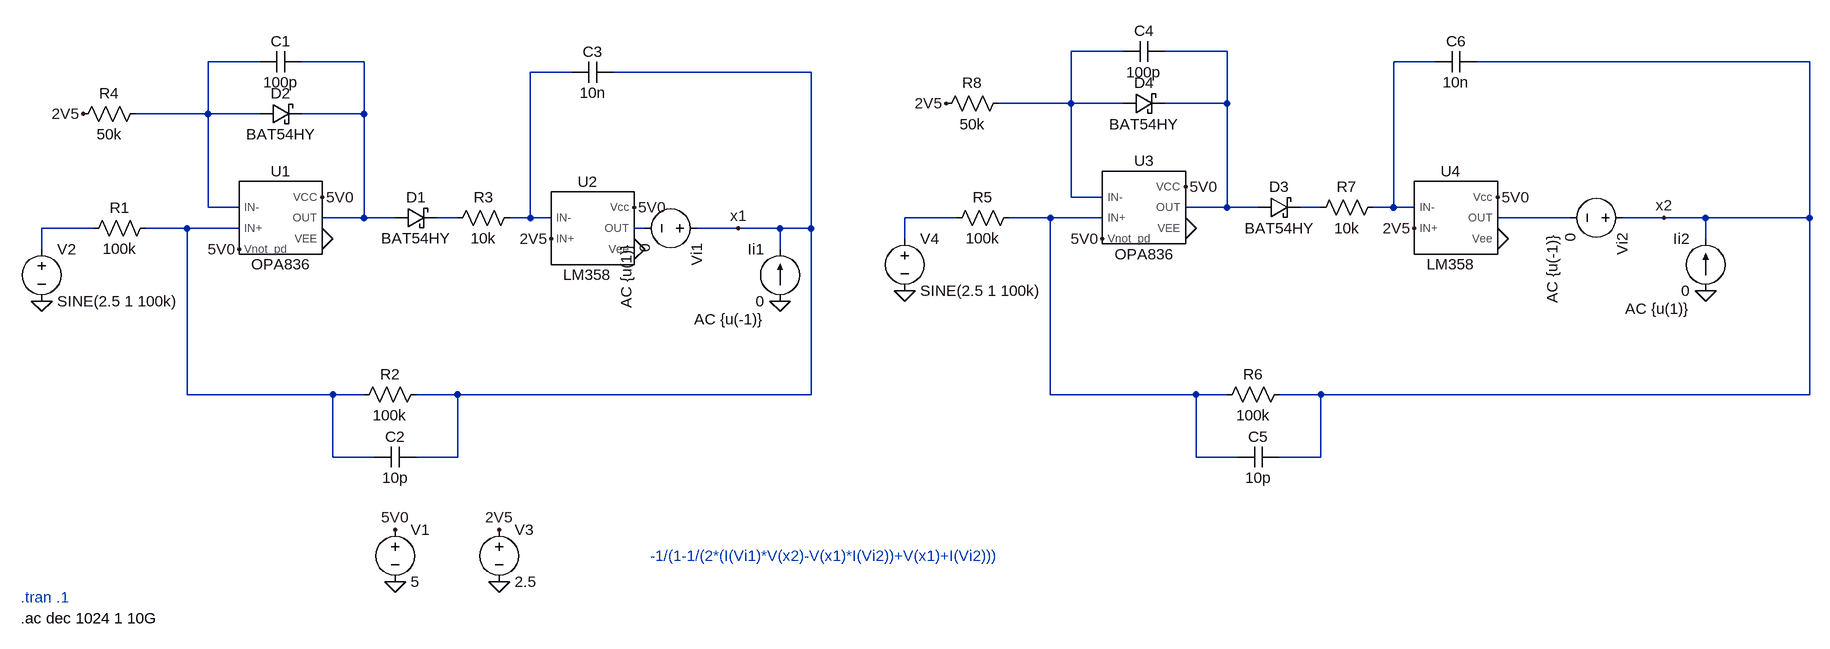
[diagram p0: schematic PeakDetector.asc]
PeakDetector.asc, the LTspice schematic file:
Version 4.1
SHEET 1 2504 1324
WIRE 1440 -96 1360 -96
WIRE 1600 -96 1504 -96
WIRE 112 -80 32 -80
WIRE 272 -80 176 -80
WIRE 1920 -80 1856 -80
WIRE 2496 -80 1984 -80
WIRE 592 -64 528 -64
WIRE 960 -64 656 -64
WIRE 1360 -16 1360 -96
WIRE 1360 -16 1248 -16
WIRE 1440 -16 1360 -16
WIRE 1600 -16 1600 -96
WIRE 1600 -16 1504 -16
WIRE 32 0 32 -80
WIRE 32 0 -80 0
WIRE 112 0 32 0
WIRE 272 0 272 -80
WIRE 272 0 176 0
WIRE 1360 128 1360 -16
WIRE 1408 128 1360 128
WIRE 32 144 32 0
WIRE 80 144 32 144
WIRE 1600 144 1600 -16
WIRE 1600 144 1536 144
WIRE 1648 144 1600 144
WIRE 1744 144 1712 144
WIRE 1856 144 1856 -80
WIRE 1856 144 1824 144
WIRE 1888 144 1856 144
WIRE 272 160 272 0
WIRE 272 160 208 160
WIRE 320 160 272 160
WIRE 416 160 384 160
WIRE 528 160 528 -64
WIRE 528 160 496 160
WIRE 560 160 528 160
WIRE 1184 160 1104 160
WIRE 1328 160 1264 160
WIRE 1408 160 1328 160
WIRE 2128 160 2016 160
WIRE 2272 160 2208 160
WIRE 2336 160 2272 160
WIRE 2496 160 2496 -80
WIRE 2496 160 2336 160
WIRE -144 176 -224 176
WIRE 0 176 -64 176
WIRE 80 176 0 176
WIRE 704 176 688 176
WIRE 848 176 784 176
WIRE 912 176 848 176
WIRE 960 176 960 -64
WIRE 960 176 912 176
WIRE 1104 192 1104 160
WIRE 2336 192 2336 160
WIRE -224 208 -224 176
WIRE 912 208 912 176
WIRE 0 432 0 176
WIRE 224 432 0 432
WIRE 272 432 224 432
WIRE 416 432 352 432
WIRE 960 432 960 176
WIRE 960 432 416 432
WIRE 1328 432 1328 160
WIRE 1552 432 1328 432
WIRE 1600 432 1552 432
WIRE 1744 432 1680 432
WIRE 2496 432 2496 160
WIRE 2496 432 1744 432
WIRE 224 528 224 432
WIRE 288 528 224 528
WIRE 416 528 416 432
WIRE 416 528 352 528
WIRE 1552 528 1552 432
WIRE 1616 528 1552 528
WIRE 1744 528 1744 432
WIRE 1744 528 1680 528
FLAG 320 720 0
FLAG 320 640 5V0
FLAG 208 192 0
FLAG 688 208 0
FLAG 208 128 5V0
FLAG 688 144 5V0
FLAG 80 208 5V0
FLAG -224 288 0
FLAG 480 720 0
FLAG 480 640 2V5
FLAG 560 192 2V5
FLAG -160 0 2V5
FLAG 1536 176 0
FLAG 2016 192 0
FLAG 1536 112 5V0
FLAG 2016 128 5V0
FLAG 1408 192 5V0
FLAG 1104 272 0
FLAG 1888 176 2V5
FLAG 1168 -16 2V5
FLAG 848 176 x1
FLAG 2272 160 x2
FLAG 912 288 0
FLAG 2336 272 0
SYMBOL OPA836 144 160 R0
SYMATTR InstName U1
SYMBOL schottky 320 176 R270
WINDOW 0 32 32 VTop 2
WINDOW 3 0 32 VBottom 2
SYMATTR InstName D1
SYMATTR Value BAT54HY
SYMATTR Description Diode
SYMATTR Type diode
SYMBOL voltage 320 624 R0
WINDOW 123 0 0 Left 0
WINDOW 39 0 0 Left 0
SYMATTR InstName V1
SYMATTR Value 5
SYMBOL res -48 160 R90
WINDOW 0 0 56 VBottom 2
WINDOW 3 32 56 VTop 2
SYMATTR InstName R1
SYMATTR Value 100k
SYMBOL res 368 416 R90
WINDOW 0 0 56 VBottom 2
WINDOW 3 32 56 VTop 2
SYMATTR InstName R2
SYMATTR Value 100k
SYMBOL schottky 112 16 R270
WINDOW 0 32 32 VTop 2
WINDOW 3 0 32 VBottom 2
SYMATTR InstName D2
SYMATTR Value BAT54HY
SYMATTR Description Diode
SYMATTR Type diode
SYMBOL cap 176 -96 R90
WINDOW 0 0 32 VBottom 2
WINDOW 3 32 32 VTop 2
SYMATTR InstName C1
SYMATTR Value 100p
SYMBOL cap 352 512 R90
WINDOW 0 0 32 VBottom 2
WINDOW 3 32 32 VTop 2
SYMATTR InstName C2
SYMATTR Value 10p
SYMBOL res 512 144 R90
WINDOW 0 0 56 VBottom 2
WINDOW 3 32 56 VTop 2
SYMATTR InstName R3
SYMATTR Value 10k
SYMBOL cap 656 -80 R90
WINDOW 0 0 32 VBottom 2
WINDOW 3 32 32 VTop 2
SYMATTR InstName C3
SYMATTR Value 10n
SYMBOL res -64 -16 R90
WINDOW 0 0 56 VBottom 2
WINDOW 3 32 56 VTop 2
SYMATTR InstName R4
SYMATTR Value 50k
SYMBOL voltage -224 192 R0
WINDOW 123 0 0 Left 0
WINDOW 39 0 0 Left 0
SYMATTR InstName V2
SYMATTR Value SINE(2.5 1 100k)
SYMBOL LM358 608 176 R0
SYMATTR InstName U2
SYMBOL voltage 480 624 R0
WINDOW 123 0 0 Left 0
WINDOW 39 0 0 Left 0
SYMATTR InstName V3
SYMATTR Value 2.5
SYMBOL OPA836 1472 144 R0
SYMATTR InstName U3
SYMBOL schottky 1648 160 R270
WINDOW 0 32 32 VTop 2
WINDOW 3 0 32 VBottom 2
SYMATTR InstName D3
SYMATTR Value BAT54HY
SYMATTR Description Diode
SYMATTR Type diode
SYMBOL res 1280 144 R90
WINDOW 0 0 56 VBottom 2
WINDOW 3 32 56 VTop 2
SYMATTR InstName R5
SYMATTR Value 100k
SYMBOL res 1696 416 R90
WINDOW 0 0 56 VBottom 2
WINDOW 3 32 56 VTop 2
SYMATTR InstName R6
SYMATTR Value 100k
SYMBOL schottky 1440 0 R270
WINDOW 0 32 32 VTop 2
WINDOW 3 0 32 VBottom 2
SYMATTR InstName D4
SYMATTR Value BAT54HY
SYMATTR Description Diode
SYMATTR Type diode
SYMBOL cap 1504 -112 R90
WINDOW 0 0 32 VBottom 2
WINDOW 3 32 32 VTop 2
SYMATTR InstName C4
SYMATTR Value 100p
SYMBOL cap 1680 512 R90
WINDOW 0 0 32 VBottom 2
WINDOW 3 32 32 VTop 2
SYMATTR InstName C5
SYMATTR Value 10p
SYMBOL res 1840 128 R90
WINDOW 0 0 56 VBottom 2
WINDOW 3 32 56 VTop 2
SYMATTR InstName R7
SYMATTR Value 10k
SYMBOL cap 1984 -96 R90
WINDOW 0 0 32 VBottom 2
WINDOW 3 32 32 VTop 2
SYMATTR InstName C6
SYMATTR Value 10n
SYMBOL res 1264 -32 R90
WINDOW 0 0 56 VBottom 2
WINDOW 3 32 56 VTop 2
SYMATTR InstName R8
SYMATTR Value 50k
SYMBOL voltage 1104 176 R0
WINDOW 123 0 0 Left 0
WINDOW 39 0 0 Left 0
SYMATTR InstName V4
SYMATTR Value SINE(2.5 1 100k)
SYMBOL LM358 1936 160 R0
SYMATTR InstName U4
SYMBOL voltage 800 176 R90
WINDOW 123 24 124 Left 2
WINDOW 39 0 0 Left 0
SYMATTR Value2 AC {u(1)}
SYMATTR InstName Vi1
SYMATTR Value 0
SYMBOL current 912 288 R180
WINDOW 0 24 80 Left 2
WINDOW 3 24 0 Left 2
WINDOW 123 24 -28 Left 2
WINDOW 39 0 0 Left 0
SYMATTR InstName Ii1
SYMATTR Value 0
SYMATTR Value2 AC {u(-1)}
SYMBOL voltage 2224 160 R90
WINDOW 123 24 124 Left 2
WINDOW 39 0 0 Left 0
SYMATTR Value2 AC {u(-1)}
SYMATTR InstName Vi2
SYMATTR Value 0
SYMBOL current 2336 272 R180
WINDOW 0 24 80 Left 2
WINDOW 3 24 0 Left 2
WINDOW 123 24 -28 Left 2
WINDOW 39 0 0 Left 0
SYMATTR InstName Ii2
SYMATTR Value 0
SYMATTR Value2 AC {u(1)}
TEXT -256 744 Left 2 ;.tran .1
TEXT 712 680 Left 2 ;-1/(1-1/(2*(I(Vi1)*V(x2)-V(x1)*I(Vi2))+V(x1)+I(Vi2)))
TEXT -256 776 Left 2 !.ac dec 1024 1 10G

The netlist it stands for:
* PeakDetector.asc
X§U1 N013 N003 N004 5V0 0 5V0 OPA836  ; pins IN+ IN- OUT VCC VEE Vnot_pd
D1 N004 N008 BAT54HY
V1 5V0 0 5
R1 N013 N012 100k
R2 x1 N013 100k
D2 N003 N004 BAT54HY
C1 N004 N003 100p
C2 x1 N013 10p
R3 N006 N008 10k
C3 x1 N006 10n
R4 N003 2V5 50k
V2 N012 0 SINE(2.5 1 100k)
X§U2 2V5 N006 5V0 0 N014 LM358  ; pins IN+ IN- Vcc Vee OUT
V3 2V5 0 2.5
X§U3 N010 N001 N002 5V0 0 5V0 OPA836  ; pins IN+ IN- OUT VCC VEE Vnot_pd
D3 N002 N007 BAT54HY
R5 N010 N009 100k
R6 x2 N010 100k
D4 N001 N002 BAT54HY
C4 N002 N001 100p
C5 x2 N010 10p
R7 N005 N007 10k
C6 x2 N005 10n
R8 N001 2V5 50k
V4 N009 0 SINE(2.5 1 100k)
X§U4 2V5 N005 5V0 0 N011 LM358  ; pins IN+ IN- Vcc Vee OUT
Vi1 x1 N014 0 AC {u(1)}
Ii1 0 x1 0 AC {u(-1)}
Vi2 x2 N011 0 AC {u(-1)}
Ii2 0 x2 0 AC {u(1)}
.model D D
.lib standard.dio
* .tran .1
* -1/(1-1/(2*(I(Vi1)*V(x2)-V(x1)*I(Vi2))+V(x1)+I(Vi2)))
.ac dec 1024 1 10G
.lib opa836_a.lib
.lib LM358.lib
.backanno
.end